# Altium project BopIt Dev.PrjPcb
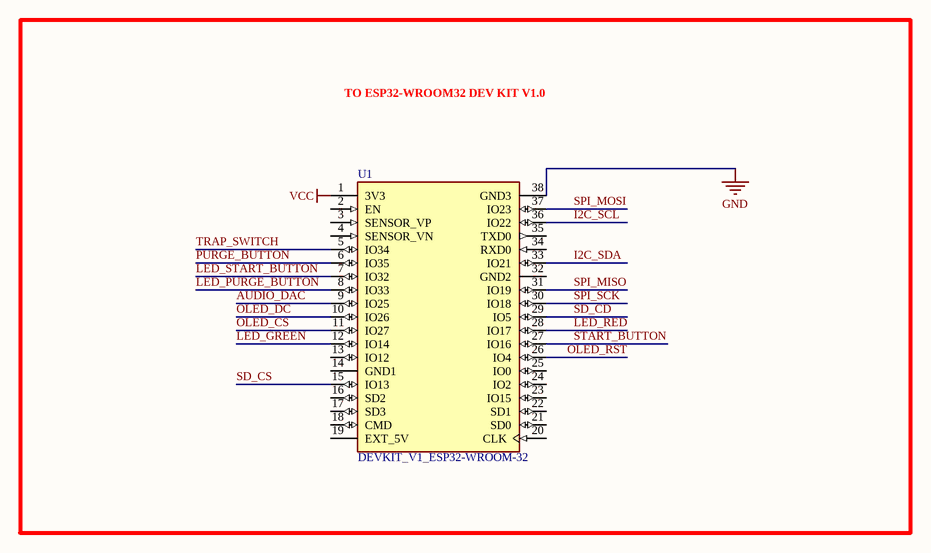
[diagram p0: DevKitESP32.SchDoc]
6 sheets, 29 parts. Net scope: global (net labels, ports and power ports of the same name join across sheets).
Board file: Motherboard.PcbDoc
Sheets:
  DevKitESP32.SchDoc
  Display.SchDoc
  Inputs.SchDoc
  Regulators.SchDoc
  MicroSDAdapter.SchDoc
  AudioAmplifier.SchDoc

## Sheet DevKitESP32.SchDoc
size A; SheetNumber: 1; SheetTotal: 6

### Parts
U1  DEVKIT_V1_ESP32-WROOM-32  [MODULE_DEVKIT_V1_ESP32-WROOM-32]

### Blocks framed on the sheet
TO ESP32-WROOM32 DEV KIT V1.0: U1

### Nets
GND: U1.38(GND3)
VCC: U1.1(3V3)
AUDIO_DAC: U1.9(IO25)
I2C_SCL: U1.36(IO22)
I2C_SDA: U1.33(IO21)
LED_GREEN: U1.12(IO14)
LED_PURGE_BUTTON: U1.8(IO33)
LED_RED: U1.28(IO17)
LED_START_BUTTON: U1.7(IO32)
OLED_CS: U1.11(IO27)
OLED_DC: U1.10(IO26)
OLED_RST: U1.26(IO4)
PURGE_BUTTON: U1.6(IO35)
SD_CD: U1.29(IO5)
SD_CS: U1.15(IO13)
SPI_MISO: U1.31(IO19)
SPI_MOSI: U1.37(IO23)
SPI_SCK: U1.30(IO18)
START_BUTTON: U1.27(IO16)
TRAP_SWITCH: U1.5(IO34)

Not connected (* = marked no-connect by the designer): U1 2(EN) 3(SENSOR_VP) 4(SENSOR_VN) 13(IO12) 14(GND1) 16(SD2) 17(SD3) 18(CMD) 19(EXT_5V) 20(CLK) 21(SD0) 22(SD1) 23(IO15) 24(IO2) 25(IO0) 32(GND2) 34(RXD0) 35(TXD0)

### Library data of the parts
U1 = DEVKIT_V1_ESP32-WROOM-32: WROOM-32 Development Board ESP32 ESP-32S WiFi Bluetooth Dev Module; MF: Espressif Systems; MP: DEVKIT V1 ESP32-WROOM-32; SnapEDA_Link: https://www.snapeda.com/parts/DEVKIT%20V1%20ESP32-WROOM-32/Espressif+Systems/view-part/?ref=snap; Package: Package; Value: *; Check_prices: https://www.snapeda.com/parts/DEVKIT%20V1%20ESP32-WROOM-32/Espressif+Systems/view-part/?ref=eda

## Sheet Display.SchDoc
size A; SheetNumber: 3; SheetTotal: 5
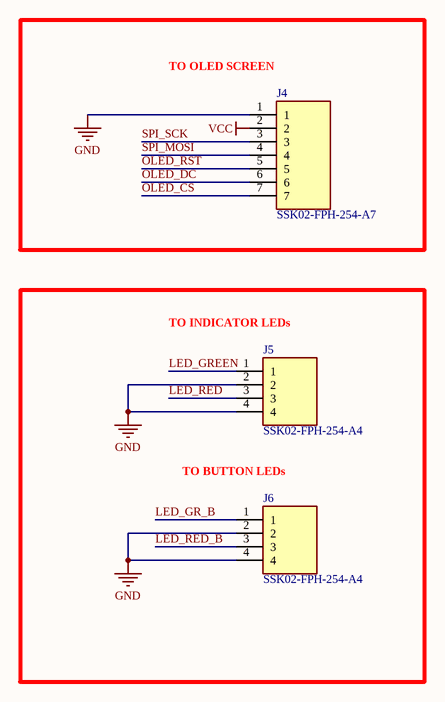
[diagram p1: Display.SchDoc]

### Parts
J4  SSK02-FPH-254-A7  [SAMESKY_SSK02-FPH-254-A7]
J5  SSK02-FPH-254-A4  [SAMESKY_SSK02-FPH-254-A4]
J6  SSK02-FPH-254-A4  [SAMESKY_SSK02-FPH-254-A4]

### Blocks framed on the sheet
TO OLED SCREEN: J4

### Nets
GND: J4.1 J5.2 J5.4 J6.2 J6.4
VCC: J4.2
LED_GR_B: J6.1
LED_GREEN: J5.1
LED_RED: J5.3
LED_RED_B: J6.3
OLED_CS: J4.7
OLED_DC: J4.6
OLED_RST: J4.5
SPI_MOSI: J4.4
SPI_SCK: J4.3

### Notes on the sheet
- (near J5) TO INDICATOR LEDs
- TO BUTTON LEDs

### Library data of the parts
J4 = SSK02-FPH-254-A7: MF: {'manufacturer': u'Same Sky (Formerly CUI Devices)'}; Package: None; Price: None; Value: *; MP: SSK02-FPH-254-A7; Availability: Unavailable
J5 J6 = SSK02-FPH-254-A4: 4 Position Header Connector 0.100 (2.54mm) Through Hole Gold; MF: Same Sky (Formerly CUI Devices); SnapEDA_Link: https://www.snapeda.com/parts/SSK02-FPH-254-A4/Same+Sky/view-part/?ref=snap; Package: None; Value: *; MP: SSK02-FPH-254-A4; Check_prices: https://www.snapeda.com/parts/SSK02-FPH-254-A4/Same+Sky/view-part/?ref=eda

## Sheet Inputs.SchDoc
size A; SheetNumber: 4; SheetTotal: 5
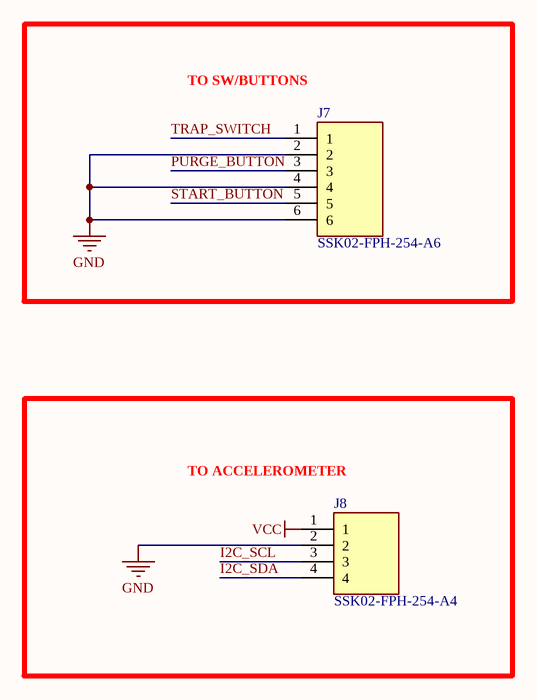
[diagram p2: Inputs.SchDoc]

### Parts
J7  SSK02-FPH-254-A6  [SAMESKY_SSK02-FPH-254-A6]
J8  SSK02-FPH-254-A4  [SAMESKY_SSK02-FPH-254-A4]

### Blocks framed on the sheet
TO SW/BUTTONS: J7
TO ACCELEROMETER: J8

### Nets
GND: J7.2 J7.4 J7.6 J8.2
VCC: J8.1
I2C_SCL: J8.3
I2C_SDA: J8.4
PURGE_BUTTON: J7.3
START_BUTTON: J7.5
TRAP_SWITCH: J7.1

### Library data of the parts
J7 = SSK02-FPH-254-A6: 6 Position Header Connector 0.100 (2.54mm) Through Hole Gold; MF: Same Sky (Formerly CUI Devices); SnapEDA_Link: https://www.snapeda.com/parts/SSK02-FPH-254-A6/Same+Sky/view-part/?ref=snap; Package: None; Value: *; MP: SSK02-FPH-254-A6; Check_prices: https://www.snapeda.com/parts/SSK02-FPH-254-A6/Same+Sky/view-part/?ref=eda
J8 = SSK02-FPH-254-A4: as J5 on sheet Display; SnapEDA_Link: https://www.snapeda.com/parts/SSK02-FPH-254-A4/Same+Sky/view-part/?ref=snap; Package: None; Value: *; MP: SSK02-FPH-254-A4; Check_prices: https://www.snapeda.com/parts/SSK02-FPH-254-A4/Same+Sky/view-part/?ref=eda

## Sheet Regulators.SchDoc
size A; SheetNumber: 5; SheetTotal: 6
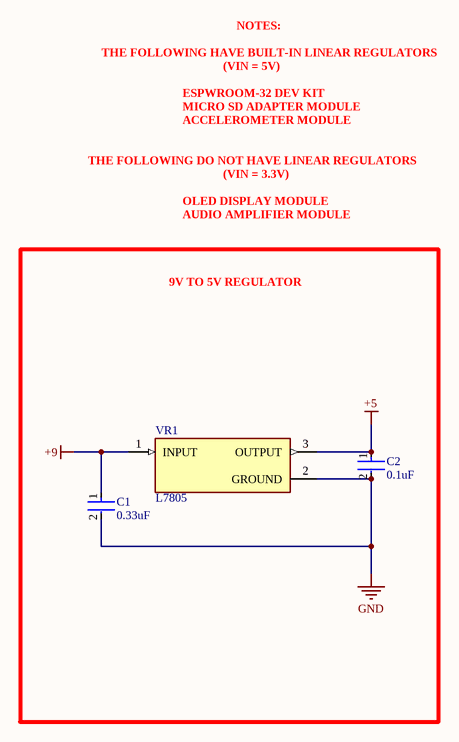
[diagram p3: Regulators.SchDoc]

### Parts
C1  0.33uF  [FP-RHE1DB-MFG]
C2  0.1uF  [FP-RHE1DB-MFG]
VR1  L7805  [TO255P1020X450X2000-3]

### Blocks framed on the sheet
9V TO 5V REGULATOR: C1 C2 VR1

### Nets
+5: C2.1 VR1.3(OUTPUT)
+9: C1.1 VR1.1(INPUT)
GND: C1.2 C2.2 VR1.2(GROUND)

### Notes on the sheet
- THE FOLLOWING HAVE BUILT-IN LINEAR REGULATORS
- (VIN = 5V)
- NOTES:
- MICRO SD ADAPTER MODULE
- ACCELEROMETER MODULE
- ESPWROOM-32 DEV KIT
- THE FOLLOWING DO NOT HAVE LINEAR REGULATORS
- OLED DISPLAY MODULE
- AUDIO AMPLIFIER MODULE
- (VIN = 3.3V)

### Library data of the parts
C1 C2 = CMP-06035-012170-1: Ceramic Capacitor Automotive 330nF ±10% 50V X8L Radial; Tolerance: 10%; Lead Pitch: 2.5mm; Capacitance: 330nF; Max Operating Temperature: 150°C; Dielectric: X8L; Voltage Rating: 50V; Voltage Rating (DC): 50V; Min Operating Temperature: -55°C; REACH SVHC: No SVHC
VR1 = L7805: Standard Regulator Pos 5V 1.5A 3-Pin(3+Tab) TO-220FP Tube; MF: STMicroelectronics; MP: L7805; Value: *; SnapEDA_Link: https://www.snapeda.com/parts/L7805/STMicroelectronics/view-part/?ref=snap; Price: None; Package: None; Check_prices: https://www.snapeda.com/parts/L7805/STMicroelectronics/view-part/?ref=eda; Availability: Not in stock

## Sheet MicroSDAdapter.SchDoc
size A; SheetNumber: 5; SheetTotal: 6
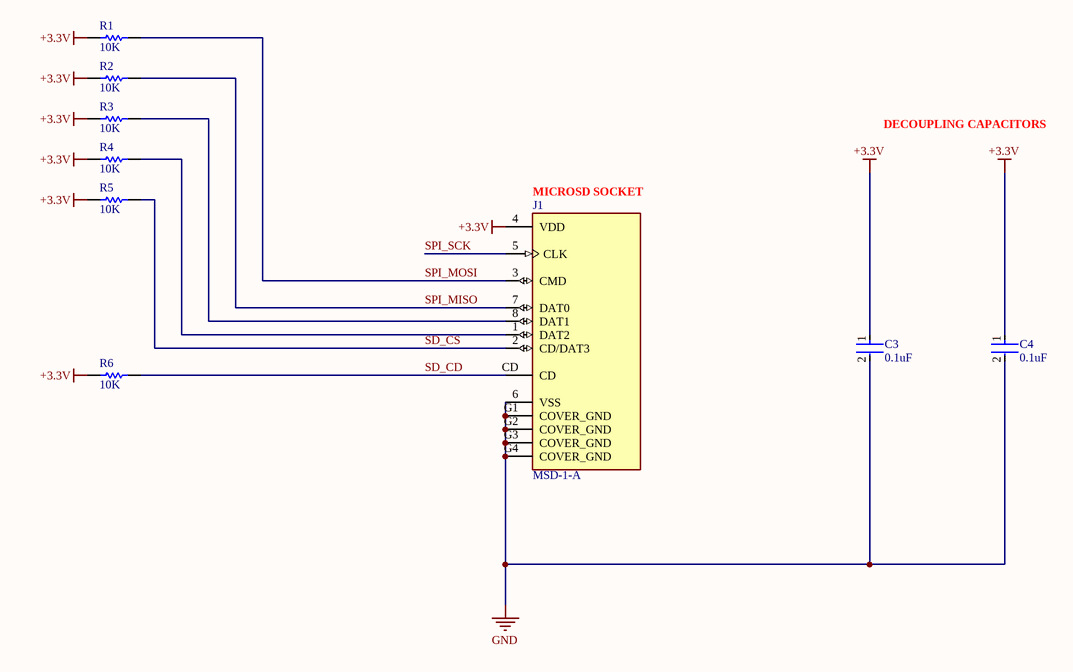
[diagram p4: MicroSDAdapter.SchDoc]

### Parts
C3  0.1uF  [FP-RHE1DB-MFG]
C4  0.1uF  [FP-RHE1DB-MFG]
J1  MSD-1-A  [CUI_MSD-1-A]
R1  10K  [RESA60-630X240]
R2  10K  [RESA60-630X240]
R3  10K  [RESA60-630X240]
R4  10K  [RESA60-630X240]
R5  10K  [RESA60-630X240]
R6  10K  [RESA60-630X240]

### Nets
+3.3V: C3.1 C4.1 J1.4(VDD) R1.2 R2.2 R3.2 R4.2 R5.2 R6.2
GND: C3.2 C4.2 J1.6(VSS) J1.G1(COVER_GND) J1.G2(COVER_GND) J1.G3(COVER_GND) J1.G4(COVER_GND)
SD_CD: J1.CD R6.1
SD_CS: J1.2(CD/DAT3) R5.1
SPI_MISO: J1.7(DAT0) R2.1
SPI_MOSI: J1.3(CMD) R1.1
SPI_SCK: J1.5(CLK)
NetJ1_1: J1.1(DAT2) R4.1
NetJ1_8: J1.8(DAT1) R3.1

### Notes on the sheet
- DECOUPLING CAPACITORS
- (near J1) MICROSD SOCKET

### Library data of the parts
C3 C4 = CMP-06035-012170-1: as C1 on sheet Regulators; Tolerance: 10%; Lead Pitch: 2.5mm; Capacitance: 330nF; Max Operating Temperature: 150°C; Dielectric: X8L; Voltage Rating: 50V; Voltage Rating (DC): 50V; Min Operating Temperature: -55°C; REACH SVHC: No SVHC
J1 = MSD-1-A: Micro SD Card Connector, 9 Positions, Connector and Ejector, Push In, Auto Eject Out, Surface Mount, 1.8 mm Height Above Board, Gold Flash; MF: Same Sky; SnapEDA_Link: https://www.snapeda.com/parts/MSD-1-A/Same+Sky/view-part/?ref=snap; Package: None; Value: *; MP: MSD-1-A; Check_prices: https://www.snapeda.com/parts/MSD-1-A/Same+Sky/view-part/?ref=eda
R1-R6 = CMP-1659-00070-1: Axial Resistor, 1 MOhm, +/- 1%, 250 mW, -55 to 155 degC, 2-Pin THD, RoHS, Bulk; Power Rating: 250 mW; Resistance: 47.5 kohm; Voltage Rating: 250 V; ComponentLink1Description: Manufacturer URL; PackageReference: MFR-25; ComponentLink2Description: Datasheet; ComponentLink2URL: http://www.yageo.com/documents/recent/Yageo%20LR_MFR_2013.pdf; Tolerance: 1%; DatasheetVersion: Apr-13; Package Quantity: 200; Packaging: Bulk; Case\Package: Axial; RoHSCompliant: true; ComponentLink1URL: http://www.yageo.com/; Length: 0.248 inch; Min Operating Temperature: -55 degC; Mount: Through Hole; PackageDescription: 2-Pin Axial Lead, Dia 2.4 mm, Body Length 6.3 mm; Max Operating Temperature: 155 degC

## Sheet AudioAmplifier.SchDoc
size A; SheetNumber: 6; SheetTotal: 6
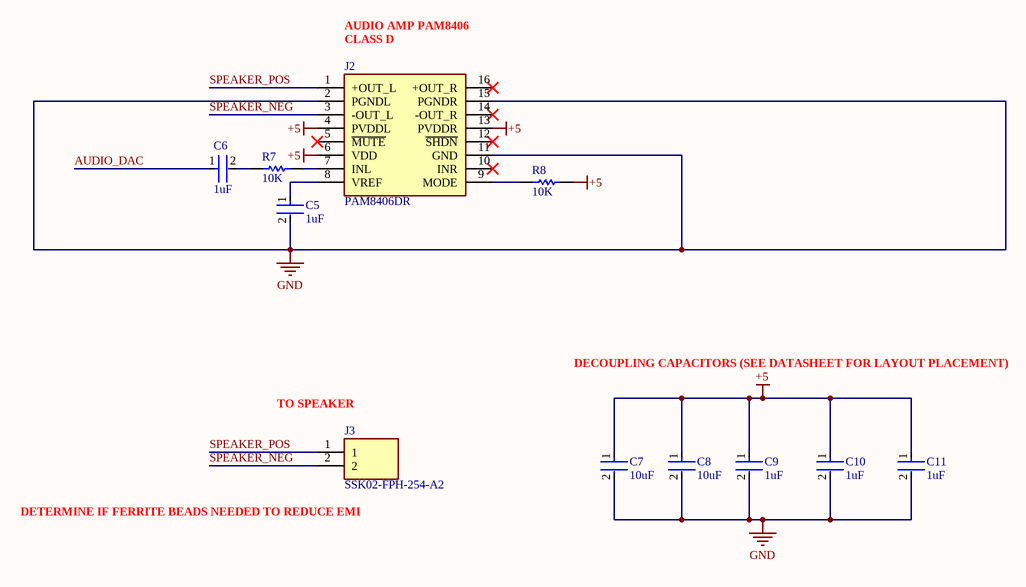
[diagram p5: AudioAmplifier.SchDoc]

### Parts
C5  1uF  [FP-RHE1DB-MFG]
C6  1uF  [FP-RHE1DB-MFG]
C7  10uF  [FP-RHE1DB-MFG]
C8  10uF  [FP-RHE1DB-MFG]
C9  1uF  [FP-RHE1DB-MFG]
C10  1uF  [FP-RHE1DB-MFG]
C11  1uF  [FP-RHE1DB-MFG]
J2  PAM8406DR  [SOIC127P600X126-16N]
J3  SSK02-FPH-254-A2  [SAMESKY_SSK02-FPH-254-A2]
R7  10K  [RESA60-630X240]
R8  10K  [RESA60-630X240]

### Nets
+5: C7.1 C8.1 C9.1 C10.1 C11.1 J2.4(PVDDL) J2.6(VDD) J2.13(PVDDR) R8.1
GND: C5.2 C7.2 C8.2 C9.2 C10.2 C11.2 J2.2(PGNDL) J2.11(GND) J2.15(PGNDR)
AUDIO_DAC: C6.1
SPEAKER_NEG: J2.3(-OUT_L) J3.2
SPEAKER_POS: J2.1(+OUT_L) J3.1
NetC5_1: C5.1 J2.8(VREF)
NetC6_2: C6.2 R7.2
NetJ2_7: J2.7(INL) R7.1
NetJ2_9: J2.9(MODE) R8.2

Not connected (* = marked no-connect by the designer): J2 5(~{MUTE})* 10(INR)* 12(~{SHDN})* 14(-OUT_R)* 16(+OUT_R)*

### Notes on the sheet
- AUDIO AMP PAM8406
- (near J2) CLASS D
- DECOUPLING CAPACITORS (SEE DATASHEET FOR LAYOUT PLACEMENT)
- (near J3) TO SPEAKER
- DETERMINE IF FERRITE BEADS NEEDED TO REDUCE EMI

### Library data of the parts
C5-C11 = CMP-06035-012170-1: as C1 on sheet Regulators; Tolerance: 10%; Lead Pitch: 2.5mm; Capacitance: 330nF; Max Operating Temperature: 150°C; Dielectric: X8L; Voltage Rating: 50V; Voltage Rating (DC): 50V; Min Operating Temperature: -55°C; REACH SVHC: No SVHC
J2 = PAM8406DR: DiodesZetex PAM8406DR 2-Channel Audio Amplifier, Class-AB, Class-D Stereo, 16-Pin SOP; Manufacturer_Name: Diodes Incorporated; Geometry.Height: 1.26mm; Manufacturer_Part_Number: PAM8406DR; Mouser Part Number: 621-PAM8406DR; Mouser Price/Stock: https://www.mouser.co.uk/ProductDetail/Diodes-Incorporated/PAM8406DR?qs=%252BSlWJf1dfkLK5VNh%252Bez%2F0Q%3D%3D; Arrow Part Number: PAM8406DR; Arrow Price/Stock: https://www.arrow.com/en/products/pam8406dr/diodes-incorporated?utm_currency=USD&region=asia; Datasheet Link: https://www.diodes.com//assets/Datasheets/PAM8406.pdf
J3 = SSK02-FPH-254-A2: 2 Position Header Connector 0.100 (2.54mm) Through Hole Gold; MF: Same Sky (Formerly CUI Devices); SnapEDA_Link: https://www.snapeda.com/parts/SSK02-FPH-254-A2/Same+Sky/view-part/?ref=snap; Package: None; Value: *; MP: SSK02-FPH-254-A2; Check_prices: https://www.snapeda.com/parts/SSK02-FPH-254-A2/Same+Sky/view-part/?ref=eda
R7 R8 = CMP-1659-00070-1: as R1 on sheet MicroSDAdapter; ComponentLink1Description: Manufacturer URL; PackageReference: MFR-25; ComponentLink2Description: Datasheet; ComponentLink2URL: http://www.yageo.com/documents/recent/Yageo%20LR_MFR_2013.pdf; Tolerance: 1%; DatasheetVersion: Apr-13; Package Quantity: 200; Packaging: Bulk; Case\Package: Axial; RoHSCompliant: true; ComponentLink1URL: http://www.yageo.com/; Length: 0.248 inch; Min Operating Temperature: -55 degC; Mount: Through Hole; PackageDescription: 2-Pin Axial Lead, Dia 2.4 mm, Body Length 6.3 mm; Max Operating Temperature: 155 degC

## Nets that join several sheets
+5: Regulators (C2.1 VR1.3), AudioAmplifier (9 pins)
GND: DevKitESP32 (U1.38), Display (5 pins), Inputs (J7.2 J7.4 J7.6 J8.2), Regulators (C1.2 C2.2 VR1.2), MicroSDAdapter (7 pins), AudioAmplifier (9 pins)
VCC: DevKitESP32 (U1.1), Display (J4.2), Inputs (J8.1)
AUDIO_DAC: DevKitESP32 (U1.9), AudioAmplifier (C6.1)
I2C_SCL: DevKitESP32 (U1.36), Inputs (J8.3)
I2C_SDA: DevKitESP32 (U1.33), Inputs (J8.4)
LED_GREEN: DevKitESP32 (U1.12), Display (J5.1)
LED_RED: DevKitESP32 (U1.28), Display (J5.3)
OLED_CS: DevKitESP32 (U1.11), Display (J4.7)
OLED_DC: DevKitESP32 (U1.10), Display (J4.6)
OLED_RST: DevKitESP32 (U1.26), Display (J4.5)
PURGE_BUTTON: DevKitESP32 (U1.6), Inputs (J7.3)
SD_CD: DevKitESP32 (U1.29), MicroSDAdapter (J1.CD R6.1)
SD_CS: DevKitESP32 (U1.15), MicroSDAdapter (J1.2 R5.1)
SPI_MISO: DevKitESP32 (U1.31), MicroSDAdapter (J1.7 R2.1)
SPI_MOSI: DevKitESP32 (U1.37), Display (J4.4), MicroSDAdapter (J1.3 R1.1)
SPI_SCK: DevKitESP32 (U1.30), Display (J4.3), MicroSDAdapter (J1.5)
START_BUTTON: DevKitESP32 (U1.27), Inputs (J7.5)
TRAP_SWITCH: DevKitESP32 (U1.5), Inputs (J7.1)